# Altium project ezlo-thermostat.PrjPcb (part 2 of 3)

## Sheet Output-Sheet.SchDoc: =Projectname
size A4; SheetNumber: 4; SheetTotal: 9
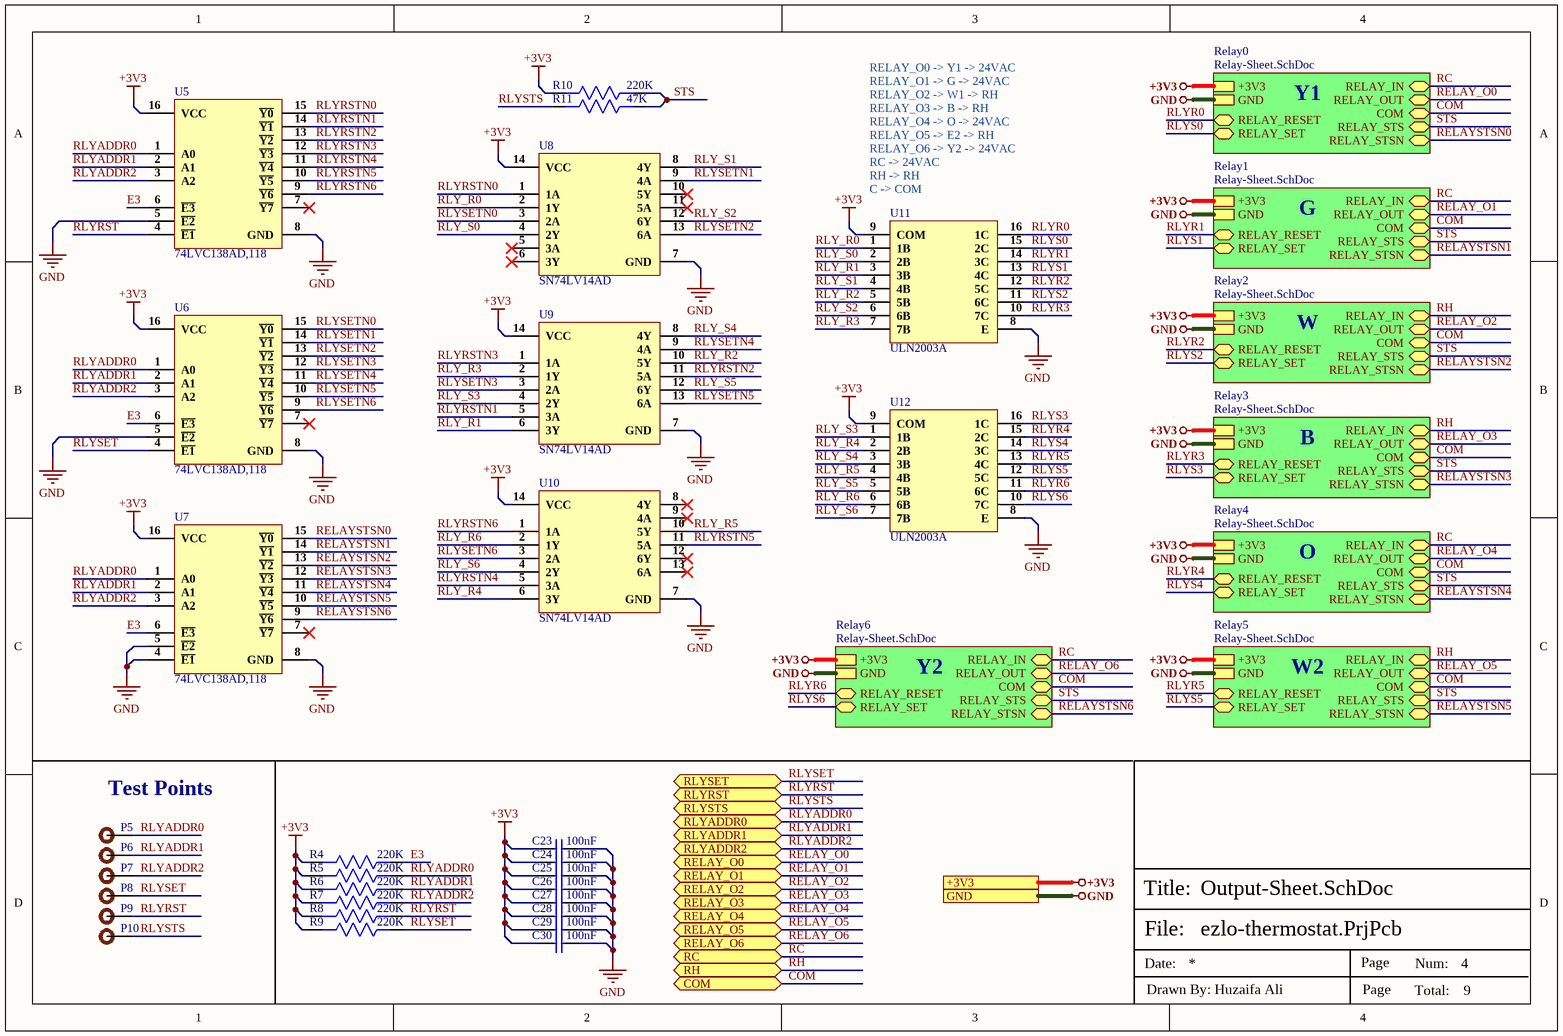
[diagram p3: Output-Sheet.SchDoc]

### Parts
C23  100nF  [Cap-0402]
C24  100nF  [Cap-0402]
C25  100nF  [Cap-0402]
C26  100nF  [Cap-0402]
C27  100nF  [Cap-0402]
C28  100nF  [Cap-0402]
C29  100nF  [Cap-0402]
C30  100nF  [Cap-0402]
P5  TEST POINT  [Test-point]  (value not drawn)
P6  TEST POINT  [Test-point]  (value not drawn)
P7  TEST POINT  [Test-point]  (value not drawn)
P8  TEST POINT  [Test-point]  (value not drawn)
P9  TEST POINT  [Test-point]  (value not drawn)
P10  TEST POINT  [Test-point]  (value not drawn)
R4  220K  [Res-0402]
R5  220K  [Res-0402]
R6  220K  [Res-0402]
R7  220K  [Res-0402]
R8  220K  [Res-0402]
R9  220K  [Res-0402]
R10  220K  [Res-0402]
R11  47K  [Res-0402]
U5  74LVC138AD,118  [16-SOIC]
U6  74LVC138AD,118  [16-SOIC]
U7  74LVC138AD,118  [16-SOIC]
U8  SN74LV14AD  [14-SOIC]
U9  SN74LV14AD  [14-SOIC]
U10  SN74LV14AD  [14-SOIC]
U11  ULN2003A  [SOP-16_150mil]
U12  ULN2003A  [SOP-16_150mil]

### Sub-sheets
Relay0 = Relay-Sheet.SchDoc: +3V3, GND, RELAY_RESET (bidir), RELAY_SET (bidir), RELAY_IN (bidir), RELAY_OUT (bidir), COM (bidir), RELAY_STS (bidir), RELAY_STSN (bidir)
Relay1 = Relay-Sheet.SchDoc: +3V3, GND, RELAY_RESET (bidir), RELAY_SET (bidir), RELAY_IN (bidir), RELAY_OUT (bidir), COM (bidir), RELAY_STS (bidir), RELAY_STSN (bidir)
Relay2 = Relay-Sheet.SchDoc: +3V3, GND, RELAY_RESET (bidir), RELAY_SET (bidir), RELAY_IN (bidir), RELAY_OUT (bidir), COM (bidir), RELAY_STS (bidir), RELAY_STSN (bidir)
Relay3 = Relay-Sheet.SchDoc: +3V3, GND, RELAY_RESET (bidir), RELAY_SET (bidir), RELAY_IN (bidir), RELAY_OUT (bidir), COM (bidir), RELAY_STS (bidir), RELAY_STSN (bidir)
Relay4 = Relay-Sheet.SchDoc: +3V3, GND, RELAY_RESET (bidir), RELAY_SET (bidir), RELAY_IN (bidir), RELAY_OUT (bidir), COM (bidir), RELAY_STS (bidir), RELAY_STSN (bidir)
Relay5 = Relay-Sheet.SchDoc: +3V3, GND, RELAY_RESET (bidir), RELAY_SET (bidir), RELAY_IN (bidir), RELAY_OUT (bidir), COM (bidir), RELAY_STS (bidir), RELAY_STSN (bidir)
Relay6 = Relay-Sheet.SchDoc: +3V3, GND, RELAY_RESET (bidir), RELAY_SET (bidir), RELAY_IN (bidir), RELAY_OUT (bidir), COM (bidir), RELAY_STS (bidir), RELAY_STSN (bidir)

### Ports
+3V3, COM (bidir), GND, RC (bidir), RELAY_O0 (bidir), RELAY_O1 (bidir), RELAY_O2 (bidir), RELAY_O3 (bidir), RELAY_O4 (bidir), RELAY_O5 (bidir), RELAY_O6 (bidir), RH (bidir), RLYADDR0 (bidir), RLYADDR1 (bidir), RLYADDR2 (bidir), RLYRST (bidir), RLYSET (bidir), RLYSTS (bidir)

### Nets
+3V3: C23.1 C24.1 C25.1 C26.1 C27.1 C28.1 C29.1 C30.1 R4.2 R5.2 R6.2 R7.2 R8.2 R9.2 R10.2 U5.16(VCC) U6.16(VCC) U7.16(VCC) U8.14(VCC) U9.14(VCC) U10.14(VCC) U11.9(COM) U12.9(COM) ; port +3V3, sheet Relay0/+3V3, sheet Relay1/+3V3, sheet Relay2/+3V3, sheet Relay3/+3V3, sheet Relay4/+3V3, sheet Relay5/+3V3, sheet Relay6/+3V3
GND: C23.2 C24.2 C25.2 C26.2 C27.2 C28.2 C29.2 C30.2 U5.5(~{E2}) U5.8(GND) U6.5(~{E2}) U6.8(GND) U7.4(~{E1}) U7.5(~{E2}) U7.8(GND) U8.7(GND) U9.7(GND) U10.7(GND) U11.8(E) U12.8(E) ; port GND, sheet Relay0/GND, sheet Relay1/GND, sheet Relay2/GND, sheet Relay3/GND, sheet Relay4/GND, sheet Relay5/GND, sheet Relay6/GND
COM: port COM, sheet Relay0/COM, sheet Relay1/COM, sheet Relay2/COM, sheet Relay3/COM, sheet Relay4/COM, sheet Relay5/COM, sheet Relay6/COM  [project net C]
E3: R4.1 U5.6(~{E3}) U6.6(~{E3}) U7.6(~{E3})
RC: port RC, sheet Relay0/RELAY_IN, sheet Relay1/RELAY_IN, sheet Relay4/RELAY_IN, sheet Relay6/RELAY_IN
RELAY_O0: port RELAY_O0, sheet Relay0/RELAY_OUT
RELAY_O1: port RELAY_O1, sheet Relay1/RELAY_OUT  [project net G]
RELAY_O2: port RELAY_O2, sheet Relay2/RELAY_OUT
RELAY_O3: port RELAY_O3, sheet Relay3/RELAY_OUT  [project net B]
RELAY_O4: port RELAY_O4, sheet Relay4/RELAY_OUT  [project net O]
RELAY_O5: port RELAY_O5, sheet Relay5/RELAY_OUT
RELAY_O6: port RELAY_O6, sheet Relay6/RELAY_OUT
RELAYSTSN0: U7.15(~{Y0}) ; sheet Relay0/RELAY_STSN  [project net RELAY_STSN]
RELAYSTSN1: U7.14(~{Y1}) ; sheet Relay1/RELAY_STSN  [project net RELAY_STSN]
RELAYSTSN2: U7.13(~{Y2}) ; sheet Relay2/RELAY_STSN  [project net RELAY_STSN]
RELAYSTSN3: U7.12(~{Y3}) ; sheet Relay3/RELAY_STSN  [project net RELAY_STSN]
RELAYSTSN4: U7.11(~{Y4}) ; sheet Relay4/RELAY_STSN  [project net RELAY_STSN]
RELAYSTSN5: U7.10(~{Y5}) ; sheet Relay5/RELAY_STSN  [project net RELAY_STSN]
RELAYSTSN6: U7.9(~{Y6}) ; sheet Relay6/RELAY_STSN  [project net RELAY_STSN]
RH: port RH, sheet Relay2/RELAY_IN, sheet Relay3/RELAY_IN, sheet Relay5/RELAY_IN  [project net RELAY_IN]
RLY_R0: U8.2(1Y) U11.1(1B)
RLY_R1: U9.6(3Y) U11.3(3B)
RLY_R2: U9.10(5Y) U11.5(5B)
RLY_R3: U9.2(1Y) U11.7(7B)
RLY_R4: U10.6(3Y) U12.2(2B)
RLY_R5: U10.10(5Y) U12.4(4B)
RLY_R6: U10.2(1Y) U12.6(6B)
RLY_S0: U8.4(2Y) U11.2(2B)
RLY_S1: U8.8(4Y) U11.4(4B)
RLY_S2: U8.12(6Y) U11.6(6B)
RLY_S3: U9.4(2Y) U12.1(1B)
RLY_S4: U9.8(4Y) U12.3(3B)
RLY_S5: U9.12(6Y) U12.5(5B)
RLY_S6: U10.4(2Y) U12.7(7B)
RLYADDR0: P5.1 R5.1 U5.1(A0) U6.1(A0) U7.1(A0) ; port RLYADDR0  [project net GPIO7]
RLYADDR1: P6.1 R6.1 U5.2(A1) U6.2(A1) U7.2(A1) ; port RLYADDR1  [project net GPIO8]
RLYADDR2: P7.1 R7.1 U5.3(A2) U6.3(A2) U7.3(A2) ; port RLYADDR2  [project net GPIO9]
RLYR0: U11.16(1C) ; sheet Relay0/RELAY_RESET  [project net RELAY_RESET]
RLYR1: U11.14(3C) ; sheet Relay1/RELAY_RESET  [project net RELAY_RESET]
RLYR2: U11.12(5C) ; sheet Relay2/RELAY_RESET  [project net RELAY_RESET]
RLYR3: U11.10(7C) ; sheet Relay3/RELAY_RESET  [project net RELAY_RESET]
RLYR4: U12.15(2C) ; sheet Relay4/RELAY_RESET  [project net RELAY_RESET]
RLYR5: U12.13(4C) ; sheet Relay5/RELAY_RESET  [project net RELAY_RESET]
RLYR6: U12.11(6C) ; sheet Relay6/RELAY_RESET  [project net RELAY_RESET]
RLYRST: P9.1 R8.1 U5.4(~{E1}) ; port RLYRST  [project net GPIO5]
RLYRSTN0: U5.15(~{Y0}) U8.1(1A)
RLYRSTN1: U5.14(~{Y1}) U9.5(3A)
RLYRSTN2: U5.13(~{Y2}) U9.11(5A)
RLYRSTN3: U5.12(~{Y3}) U9.1(1A)
RLYRSTN4: U5.11(~{Y4}) U10.5(3A)
RLYRSTN5: U5.10(~{Y5}) U10.11(5A)
RLYRSTN6: U5.9(~{Y6}) U10.1(1A)
RLYS0: U11.15(2C) ; sheet Relay0/RELAY_SET  [project net RELAY_SET]
RLYS1: U11.13(4C) ; sheet Relay1/RELAY_SET  [project net RELAY_SET]
RLYS2: U11.11(6C) ; sheet Relay2/RELAY_SET  [project net RELAY_SET]
RLYS3: U12.16(1C) ; sheet Relay3/RELAY_SET  [project net RELAY_SET]
RLYS4: U12.14(3C) ; sheet Relay4/RELAY_SET  [project net RELAY_SET]
RLYS5: U12.12(5C) ; sheet Relay5/RELAY_SET  [project net RELAY_SET]
RLYS6: U12.10(7C) ; sheet Relay6/RELAY_SET  [project net RELAY_SET]
RLYSET: P8.1 R9.1 U6.4(~{E1}) ; port RLYSET  [project net GPIO4]
RLYSETN0: U6.15(~{Y0}) U8.3(2A)
RLYSETN1: U6.14(~{Y1}) U8.9(4A)
RLYSETN2: U6.13(~{Y2}) U8.13(6A)
RLYSETN3: U6.12(~{Y3}) U9.3(2A)
RLYSETN4: U6.11(~{Y4}) U9.9(4A)
RLYSETN5: U6.10(~{Y5}) U9.13(6A)
RLYSETN6: U6.9(~{Y6}) U10.3(2A)
RLYSTS: P10.1 R11.2 ; port RLYSTS  [project net GPIO6]
STS: R10.1 R11.1 ; sheet Relay0/RELAY_STS, sheet Relay1/RELAY_STS, sheet Relay2/RELAY_STS, sheet Relay3/RELAY_STS, sheet Relay4/RELAY_STS, sheet Relay5/RELAY_STS, sheet Relay6/RELAY_STS  [project net RELAY_STS]

Not connected (* = marked no-connect by the designer): U5 7(~{Y7})*; U6 7(~{Y7})*; U7 7(~{Y7})*; U8 5(3A)* 6(3Y)* 10(5Y)* 11(5A)*; U10 8(4Y)* 9(4A)* 12(6Y)* 13(6A)*

### Notes on the sheet
- Y1
- (near U11) RELAY_O0 -> Y1 -> 24VAC
  RELAY_O1 -> G -> 24VAC
  RELAY_O2 -> W1 -> RH
  RELAY_O3 -> B -> RH
  RELAY_O4 -> O -> 24VAC
  RELAY_O5 -> E2 -> RH
  RELAY_O6 -> Y2 -> 24VAC
  RC -> 24VAC
  RH -> RH
  C -> COM
- G
- W
- B
- O
- Y2
- W2
- Test Points
- File:
- Title:
- Date:
- Page
- Num:
- Total:
- Drawn By: Huzaifa Ali

### Library data of the parts
C23-C30 = CC0402KRX5R8BB104: CAP CER 0.1UF 25V X5R 0402; Manufacturer: Yageo; Tolerance: 10%; Item Type: Capacitor; Supplier 1: Digi-Key; Manufacturer Part Number: CC0402KRX5R8BB104; RoHS: Yes; Category: Ceramic Capacitors; Stock 1: 4598218; Pricing 1: 1=0.10000, 10=0.03800, 50=0.02100, 100=0.01710, 500=0.01224, 1000=0.00961, 2500=0.00874, 5000=0.00804 (USD); Mount: Surface Mount; Case/Package: 0402; Case Code (Metric): 1005; Case Code (Imperial): 0402; Min Operating Temperature: -55°C; Max Operating Temperature: 85°C; Voltage Rating: 25V; Packaging: Tape and Reel; Capacitance: 100nF; Voltage Rating (DC): 25V; Dielectric: X5R; Resistor Type: Ceramic; Series: CC; Length: 0.039inch; Width: 0.02inch; Thickness: 0.022inch; Depth: 0.5mm; Lead Free: Lead Free; Halogen Free: Halogen Free; RoHS Compliant: Yes; ComponentLink1URL: http://www.mouser.com/ds/2/447/UPY-GPHC_X5R_4V-to-50V_25-1131599.pdf?src-supplier=Mouser; ComponentLink1Description: http://www.mouser.com/ds/2/447/UPY-GPHC_X5R_4V-to-50V_25-1131599.pdf?src-supplier=Mouser; ComponentLink2URL: http://www.yageo.com/documents/recent/UPY-GPHC_X5R_4V-to-50V-16.pdf?src-supplier=Future+Electronics; ComponentLink2Description: http://www.yageo.com/documents/recent/UPY-GPHC_X5R_4V-to-50V-16.pdf?src-supplier=Future+Electronics; ComponentLink3URL: http://www.yageo.com/documents/recent/UPY-GPHC_X5R_4V-to-50V_25.pdf?src-supplier=Digi-Key; ComponentLink3Description: http://www.yageo.com/documents/recent/UPY-GPHC_X5R_4V-to-50V_25.pdf?src-supplier=Digi-Key; Supplier Part Number 1: 311-1697-1-ND; LCSC Part Number: C106256
P5-P10 = TEST POINT: Test Point ON
R4-R10 = RC0402FR-07220KL: RES 220K OHM 1% 1/16W 0402; Manufacturer: Yageo; Resistance: 220kR; Power Rating: 62.5mW; Voltage Rating: 50V; Temperature Coefficient: 100ppm/°C; Max Power Dissipation: 63mW; Supplier 1: Digi-Key; Manufacturer Part Number: RC0402FR-07220KL; RoHS: Yes; Category: Chip SMD Resistors; Stock 1: 1192792; Pricing 1: 1=0.10000, 10=0.01400, 100=0.00580, 1000=0.00262, 2500=0.00228, 5000=0.00188 (USD); Case/Package: 0402; Case Code (Imperial): 0402; Case Code (Metric): 1005; Weight: 2.3E-05oz; Size Code: 0402; Min Operating Temperature: -55°C; Max Operating Temperature: 155°C; Tolerance: 1%; Package Quantity: 1; Packaging: Tape and Reel; Termination: SMD/SMT; Resistor Type: Thick Film; Number of Terminations: 2; Features: Moisture Resistant; Series: RC; Resistance Tolerance: 1%; Technology: THICK FILM; Construction: Rectangular; Length: 1mm; Width: 0.02inch; Height: 0.016inch; Depth: 0.5mm; RoHS Compliant: Yes; Reach SVHC Compliant: Yes; Military Standard: Not; Lead Free: Lead Free; ComponentLink1URL: https://datasheet.ciiva.com/11808/0900766b80c66297-11808792.pdf?src-supplier=RSComponents; ComponentLink1Description: https://datasheet.ciiva.com/11808/0900766b80c66297-11808792.pdf?src-supplier=RSComponents; ComponentLink2URL: https://datasheet.ciiva.com/5924/1018594-5924944.pdf?src-supplier=Farnell; ComponentLink2Description: https://datasheet.ciiva.com/5924/1018594-5924944.pdf?src-supplier=Farnell; ComponentLink3URL: https://datasheet.ciiva.com/2453/pyu-r-int-thick-7-2453533.pdf?src-supplier=Digi-Key; ComponentLink3Description: https://datasheet.ciiva.com/2453/pyu-r-int-thick-7-2453533.pdf?src-supplier=Digi-Key; ComponentLink4URL: https://datasheet.ciiva.com/2453/pyu-r-int-thick-7-2453534.pdf?src-supplier=Digi-Key; ComponentLink4Description: https://datasheet.ciiva.com/2453/pyu-r-int-thick-7-2453534.pdf?src-supplier=Digi-Key; ComponentLink5URL: https://datasheet.ciiva.com/2453/pyu-r-int-thick-7-2453532.pdf?src-supplier=Digi-Key; ComponentLink5Description: https://datasheet.ciiva.com/2453/pyu-r-int-thick-7-2453532.pdf?src-supplier=Digi-Key; ComponentLink6URL: https://datasheet.ciiva.com/12577/pyu-rc0402-51-rohs-l-6-r-12577270.pdf?src-supplier=Mouser; ComponentLink6Description: https://datasheet.ciiva.com/12577/pyu-rc0402-51-rohs-l-6-r-12577270.pdf?src-supplier=Mouser; Supplier Part Number 1: 311-220KLRCT-ND
R11 = RC0402FR-0747KL: RES 47K OHM 1% 1/16W 0402; Manufacturer: Yageo; Power Rating: 62.5mW; Temperature Coefficient: 100ppm/°C; Voltage Rating: 50V; Resistance: 47kR; Max Power Dissipation: 63mW; Item Type: Resistor; Supplier 1: Avnet; Manufacturer Part Number: RC0402FR-0747KL; RoHS: Yes; Category: Chip SMD Resistors; Stock 1: 680000; Pricing 1: 10000=0.00085, 20000=0.00087, 40000=0.00084, 60000=0.00083, 80000=0.00079, 100000=0.00078, 1000000=0.00076 (USD); Case/Package: 0402; Case Code (Imperial): 0402; Case Code (Metric): 1005; Size Code: 0402; Min Operating Temperature: -55°C; Max Operating Temperature: 155°C; Tolerance: 1%; Series: RC; Packaging: Tape and Reel; Package Quantity: 1; Termination: SMD/SMT; Resistor Type: Thick Film; Number of Terminations: 2; Features: Moisture Resistant; Resistance Tolerance: 1%; Construction: Rectangular; Length: 1mm; Width: 0.02inch; Height: 0.016inch; Depth: 0.5mm; RoHS Compliant: Yes; Military Standard: Not; Lead Free: Lead Free; ComponentLink1URL: https://datasheet.ciiva.com/46412/1018594-46412839.pdf?src-supplier=Element14; ComponentLink1Description: https://datasheet.ciiva.com/46412/1018594-46412839.pdf?src-supplier=Element14; ComponentLink2URL: https://datasheet.ciiva.com/2453/pyu-r-int-thick-7-2453389.pdf?src-supplier=Digi-Key; ComponentLink2Description: https://datasheet.ciiva.com/2453/pyu-r-int-thick-7-2453389.pdf?src-supplier=Digi-Key; ComponentLink3URL: https://datasheet.ciiva.com/2453/pyu-r-int-thick-7-2453390.pdf?src-supplier=Digi-Key; ComponentLink3Description: https://datasheet.ciiva.com/2453/pyu-r-int-thick-7-2453390.pdf?src-supplier=Digi-Key; ComponentLink4URL: https://datasheet.ciiva.com/2453/pyu-r-int-thick-7-2453388.pdf?src-supplier=Digi-Key; ComponentLink4Description: https://datasheet.ciiva.com/2453/pyu-r-int-thick-7-2453388.pdf?src-supplier=Digi-Key; ComponentLink5URL: https://datasheet.ciiva.com/15189/getdatasheetpartid-323748-15189466.pdf?src-supplier=Verical; ComponentLink5Description: https://datasheet.ciiva.com/15189/getdatasheetpartid-323748-15189466.pdf?src-supplier=Verical; ComponentLink6URL: https://datasheet.ciiva.com/16793/pyu-rc0402-51-rohs-l-6-r-16793430.pdf?src-supplier=Future+Electronics; ComponentLink6Description: https://datasheet.ciiva.com/16793/pyu-rc0402-51-rohs-l-6-r-16793430.pdf?src-supplier=Future+Electronics; Supplier Part Number 1: RC0402FR-0747KL; LCSC Part Number: C93943
U5-U7 = 74LVC138AD,118: IC DECODER/DEMUX 3-8 INV 16SOIC; Manufacturer: Nexperia; Supplier 1: Avnet; Manufacturer Part Number: 74LVC138AD,118; RoHS: Yes; Category: Decoders and Multiplexers; Stock 1: 17684; Pricing 1: 2995=0.11690, 3000=0.11440, 6000=0.11189, 15000=0.10939, 30000=0.10688, 150000=0.10438, 300000=0.10187 (USD); RoHS Compliant: Yes; Supplier Part Number 1: 74LVC138AD,118; LCSC Part Number: C6061; Item Type: IC; ComponentLink1Description: LCSC; ComponentLink1URL: https://www.lcsc.com/product-detail/Signal-Switches-Encoders-Decoders-Multiplexers_Nexperia-74LVC138AD-118_C6061.html
U8-U10 = SN74LV14AD: SOIC-14 Inverters ROHS; Manufacturer: Texas Instruments; Logic Function: Buffer,Inverter,Schmitt Trigger; Number of Elements: 6; Output Current: 12mA; Number of Inputs: 1; Min Supply Voltage: 2V; Max Supply Voltage: 5.5V; Propagation Delay: 27ns; Quiescent Current: 20uA; High Level Output Current: -12mA; Turn-On Delay Time: 12ns; Input Type: SCHMITT TRIGGER; Schmitt Trigger Input: Yes; Item Type: IC; Supplier 1: Digi-Key; Manufacturer Part Number: SN74LV14AD; RoHS: Yes; Category: Logic Gates; Stock 1: 2467; Pricing 1: 1=1.16000, 10=1.04100, 25=0.98840, 100=0.81190, 250=0.75892, 500=0.67066, 1000=0.52947, 2500=0.49950 (USD); Mount: Surface Mount; Case/Package: SOIC; Number of Pins: 14; Weight: 0.004318oz; Min Operating Temperature: -40°C; Max Operating Temperature: 125°C; Package Quantity: 50; Packaging: Rail/Tube; Number of Circuits: 6; Low Level Output Current: 12mA; Series: 74LV; Technology: CMOS; Number of Bits: 6; Number of Gates: 6; Length: 8.65mm; Width: 3.91mm; Height: 1.58mm; Radiation Hardening: No; Lead Free: Lead Free; RoHS Compliant: Yes; Reach SVHC Compliant: Yes; ComponentLink1URL: https://datasheet.ciiva.com/27050/917231-27050962.pdf?src-supplier=Jameco; ComponentLink1Description: https://datasheet.ciiva.com/27050/917231-27050962.pdf?src-supplier=Jameco; ComponentLink2URL: https://datasheet.ciiva.com/7948/1633820-7948979.pdf?src-supplier=Element14; ComponentLink2Description: https://datasheet.ciiva.com/7948/1633820-7948979.pdf?src-supplier=Element14; ComponentLink3URL: https://datasheet.ciiva.com/15089/getdatasheetpartid-253475-15089486.pdf?src-supplier=Verical; ComponentLink3Description: https://datasheet.ciiva.com/15089/getdatasheetpartid-253475-15089486.pdf?src-supplier=Verical; ComponentLink4URL: https://datasheet.ciiva.com/1866/sn74lv14a-1866324.pdf?src-supplier=Digi-Key; ComponentLink4Description: https://datasheet.ciiva.com/1866/sn74lv14a-1866324.pdf?src-supplier=Digi-Key; ComponentLink5URL: https://datasheet.ciiva.com/14290/sn74lv14a-14290269.pdf?src-supplier=Avnet; ComponentLink5Description: https://datasheet.ciiva.com/14290/sn74lv14a-14290269.pdf?src-supplier=Avnet; Supplier Part Number 1: 296-1678-5-ND; LCSC Part Number: C2860778
U11 U12 = ULN2003A: 100uA@50V 3V@2V,300mA 1.6V@350mA 4mA@12V 100uA@50V 1.25V@350mA 500mA 25pF SOP-16_150mil Darlington Transistor Arrays ROHS; Manufacturer: Mixic; Item Type: IC; Manufacturer Part Number: ULN2003A; Package: SOP-16_150mil; LCSC Part Number: C181730; ComponentLink1Description: LCSC; ComponentLink1URL: https://www.lcsc.com/product-detail/Darlington-Transistor-Arrays_Mixic-ULN2003A_C181730.html

## Sheet Relay-Sheet.SchDoc: =Projectname
size A4; SheetNumber: 6; SheetTotal: 9
Used 7 times, as channels U_Output-Sheet/Relay0, U_Output-Sheet/Relay1, U_Output-Sheet/Relay2, U_Output-Sheet/Relay3, U_Output-Sheet/Relay4, U_Output-Sheet/Relay5, U_Output-Sheet/Relay6. Parts and nets are listed once, with the designators drawn on the sheet.
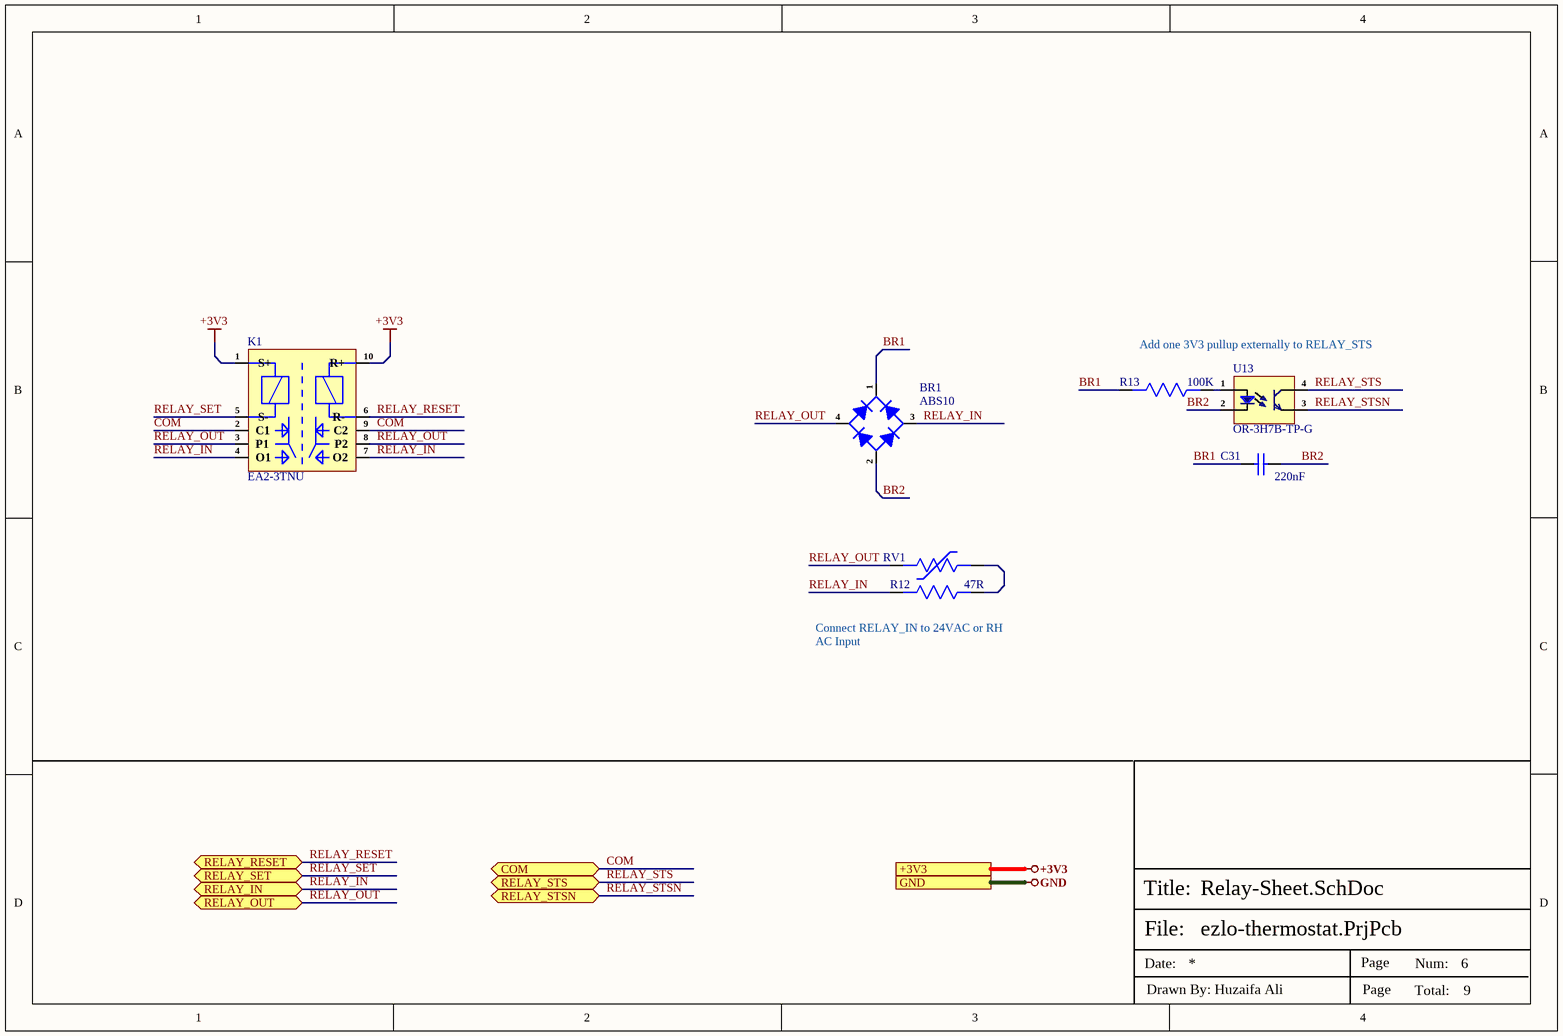
[diagram p4: Relay-Sheet.SchDoc]

### Parts
BR1  ABS10  [ABS]
C31  220nF  [Cap-1206]
K1  EA2-3TNU  [EA2-3TNU]
R12  47R  [Res-0402]
R13  100K  [Res-0402]
RV1  ERZ-V07D680  [ERZ-V07D680]  (value not drawn)
U13  OR-3H7B-TP-G  [SOP-4-1.27mm pitch Body 2.6mm]

### Ports
+3V3, COM (bidir), GND, RELAY_IN (bidir), RELAY_OUT (bidir), RELAY_RESET (bidir), RELAY_SET (bidir), RELAY_STS (bidir), RELAY_STSN (bidir)

### Nets
+3V3: K1.1(S+) K1.10(R+) ; port +3V3
BR1: BR1.1 C31.2 R13.2
BR2: BR1.2 C31.1 U13.2(Ca)
COM: K1.2(C1) K1.9(C2) ; port COM
RELAY_IN: BR1.3 K1.4(O1) K1.7(O2) R12.2 ; port RELAY_IN
RELAY_OUT: BR1.4 K1.3(P1) K1.8(P2) RV1.2 ; port RELAY_OUT
RELAY_RESET: K1.6(R-) ; port RELAY_RESET
RELAY_SET: K1.5(S-) ; port RELAY_SET
RELAY_STS: U13.4(C) ; port RELAY_STS
RELAY_STSN: U13.3(E) ; port RELAY_STSN
NetR12_1: R12.1 RV1.1
NetR13_1: R13.1 U13.1(An)

### Channels
U_Output-Sheet/Relay0: designators end in _Relay0; ports +3V3=+3V3 COM=C GND=GND RELAY_IN=RC RELAY_OUT=RELAY_O0 RELAY_RESET=RELAY_RESET RELAY_SET=RELAY_SET RELAY_STS=RELAY_STS RELAY_STSN=RELAY_STSN
U_Output-Sheet/Relay1: designators end in _Relay1; ports +3V3=+3V3 COM=C GND=GND RELAY_IN=RC RELAY_OUT=G RELAY_RESET=RELAY_RESET RELAY_SET=RELAY_SET RELAY_STS=RELAY_STS RELAY_STSN=RELAY_STSN
U_Output-Sheet/Relay2: designators end in _Relay2; ports +3V3=+3V3 COM=C GND=GND RELAY_IN=RELAY_IN RELAY_OUT=RELAY_O2 RELAY_RESET=RELAY_RESET RELAY_SET=RELAY_SET RELAY_STS=RELAY_STS RELAY_STSN=RELAY_STSN
U_Output-Sheet/Relay3: designators end in _Relay3; ports +3V3=+3V3 COM=C GND=GND RELAY_IN=RELAY_IN RELAY_OUT=B RELAY_RESET=RELAY_RESET RELAY_SET=RELAY_SET RELAY_STS=RELAY_STS RELAY_STSN=RELAY_STSN
U_Output-Sheet/Relay4: designators end in _Relay4; ports +3V3=+3V3 COM=C GND=GND RELAY_IN=RC RELAY_OUT=O RELAY_RESET=RELAY_RESET RELAY_SET=RELAY_SET RELAY_STS=RELAY_STS RELAY_STSN=RELAY_STSN
U_Output-Sheet/Relay5: designators end in _Relay5; ports +3V3=+3V3 COM=C GND=GND RELAY_IN=RELAY_IN RELAY_OUT=RELAY_O5 RELAY_RESET=RELAY_RESET RELAY_SET=RELAY_SET RELAY_STS=RELAY_STS RELAY_STSN=RELAY_STSN
U_Output-Sheet/Relay6: designators end in _Relay6; ports +3V3=+3V3 COM=C GND=GND RELAY_IN=RC RELAY_OUT=RELAY_O6 RELAY_RESET=RELAY_RESET RELAY_SET=RELAY_SET RELAY_STS=RELAY_STS RELAY_STSN=RELAY_STSN

### Notes on the sheet
- Add one 3V3 pullup externally to RELAY_STS
- (near R12) Connect RELAY_IN to 24VAC or RH
  AC Input
- File:
- Title:
- Date:
- Page
- Num:
- Total:
- Drawn By: Huzaifa Ali

### Library data of the parts
BR1 = ABS10: 5uA@1kV 1V@0.4A 1A 1kV -55℃~+150℃@(Tj) ABS Bridge Rectifiers ROHS; Manufacturer: FOSAN; Package: ABS; Manufacturer Part Number: ABS10; Item Type: Bridge Rectifier; LCSC Part Number: C3014049; ComponentLink1Description: LCSC; ComponentLink1URL: https://www.lcsc.com/product-detail/Bridge-Rectifiers_FOSAN-ABS10_C3014049.html
C31 = 1206B224K500NT: 50V 220nF X7R ±10% 1206 Multilayer Ceramic Capacitors MLCC - SMD/SMT ROHS; Manufacturer: FH; Manufacturer Part Number: 1206B224K500NT; Package: 1206; LCSC Part Number: C1857; Item Type: Capacitor; ComponentLink1Description: LCSC; ComponentLink1URL: https://www.lcsc.com/product-detail/Multilayer-Ceramic-Capacitors-MLCC-SMD-SMT_FH-Guangdong-Fenghua-Advanced-Tech-1206B224K500NT_C1857.html
K1 = EA2-3TNU: Relay Gen Purpose DPDT 1A 3VDC; Manufacturer: KEMET; Coil Current: 46.7mA; Coil Type: Latching, Dual Coil; Coil Voltage (DC): 3V; Coil Resistance: 64.3R; Relay Type: General Purpose; Operate Time: 2ms; Release Time: 1ms; Coil Power: 140mW; Supplier 1: Mouser; Manufacturer Part Number: EA2-3TNU; RoHS: No; Category: Uncategorized; Stock 1: 873; Pricing 1: 1=3.85000, 10=3.11000, 50=3.11000, 100=2.42000, 250=2.00000, 500=1.85000, 1000=1.85000, 3600=1.58000, 10000=1.58000 (USD); Mount: Through Hole; Contact Material: Gold,Silver; Min Operating Temperature: -40°C; Max Operating Temperature: 85°C; Throw Configuration: DPDT; Package Quantity: 3600; Termination: PC Pin; Packaging: Rail/Tube; Contact Current Rating: 1A; RoHS Compliant: No; ComponentLink1URL: https://api.kemet.com/component-edge/download/datasheet/EA2-3TNU.pdf?src-supplier=Digi-Key; ComponentLink1Description: https://api.kemet.com/component-edge/download/datasheet/EA2-3TNU.pdf?src-supplier=Digi-Key; Supplier Part Number 1: 80-EA2-3TNU; LCSC Part Number: C1560650; Item Type: Relay
R12 = RC0402FR-0747RL: RES 47 OHM 1% 1/16W 0402; Manufacturer: Yageo; Temperature Coefficient: 100ppm/°C; Power Rating: 63mW; Voltage Rating: 50V; Supplier 1: Digi-Key; Manufacturer Part Number: RC0402FR-0747RL; RoHS: Yes; Category: Chip SMD Resistors; Stock 1: 913647; Pricing 1: 1=0.10000, 10=0.01400, 100=0.00580, 1000=0.00262, 2500=0.00228, 5000=0.00188 (USD); Case/Package: 0402; Case Code (Metric): 1005; Case Code (Imperial): 0402; Weight: 2.3E-05oz; Size Code: 0402; Min Operating Temperature: -55°C; Max Operating Temperature: 155°C; Resistance: 47R; Tolerance: 1%; Packaging: Tape and Reel; Resistor Type: Thick Film; Package Quantity: 1; Number of Terminations: 2; Termination: SMD/SMT; Max Power Dissipation: 63mW; Features: Moisture Resistant; Series: RC; Construction: Rectangular; Technology: THICK FILM; Resistance Tolerance: 1%; Length: 1mm; Width: 0.02inch; Height: 0.016inch; Depth: 0.5mm; Lead Free: Lead Free; Military Standard: Not; RoHS Compliant: Yes; Supplier Part Number 1: 311-47.0LRCT-ND
R13 = RC0402FR-07100KL: RES 100K OHM 1% 1/16W 0402; Manufacturer: Yageo; Resistance: 100kR; Temperature Coefficient: 100ppm/°C; Power Rating: 63mW; Voltage Rating: 50V; Supplier 1: Mouser; Manufacturer Part Number: RC0402FR-07100KL; RoHS: Yes; Category: Chip SMD Resistors; Stock 1: 7759549; Pricing 1: 1=0.10000, 10=0.01200, 50=0.01200, 100=0.00500, 1000=0.00300, 2500=0.00200, 10000=0.00100 (USD); Case/Package: 0402; Case Code (Metric): 1005; Case Code (Imperial): 0402; Min Operating Temperature: -55°C; Max Operating Temperature: 155°C; Resistor Type: Thick Film; Tolerance: 1%; Packaging: Tape and Reel; Package Quantity: 1; Number of Terminations: 2; Termination: SMD/SMT; Max Power Dissipation: 63mW; Working Voltage: 50V; Features: Moisture Resistant; Series: RC; Resistance Tolerance: 1%; Construction: Rectangular; Technology: THICK FILM; Length: 0.039inch; Width: 0.02inch; Height: 0.016inch; Depth: 0.5mm; REACH SVHC: No SVHC; Lead Free: Lead Free; RoHS Compliant: Yes; Military Standard: Not; ComponentLink1URL: https://datasheet.ciiva.com/11819/0900766b80c66297-11819452.pdf?src-supplier=RSComponents; ComponentLink1Description: https://datasheet.ciiva.com/11819/0900766b80c66297-11819452.pdf?src-supplier=RSComponents; ComponentLink2URL: https://datasheet.ciiva.com/22747/1018594-22747509.pdf?src-supplier=Element14; ComponentLink2Description: https://datasheet.ciiva.com/22747/1018594-22747509.pdf?src-supplier=Element14; ComponentLink3URL: https://datasheet.ciiva.com/2453/pyu-r-int-thick-7-2453362.pdf?src-supplier=Digi-Key; ComponentLink3Description: https://datasheet.ciiva.com/2453/pyu-r-int-thick-7-2453362.pdf?src-supplier=Digi-Key; ComponentLink4URL: https://datasheet.ciiva.com/2453/pyu-r-int-thick-7-2453363.pdf?src-supplier=Digi-Key; ComponentLink4Description: https://datasheet.ciiva.com/2453/pyu-r-int-thick-7-2453363.pdf?src-supplier=Digi-Key; ComponentLink5URL: https://datasheet.ciiva.com/2453/pyu-r-int-thick-7-2453361.pdf?src-supplier=Digi-Key; ComponentLink5Description: https://datasheet.ciiva.com/2453/pyu-r-int-thick-7-2453361.pdf?src-supplier=Digi-Key; ComponentLink6URL: https://datasheet.ciiva.com/12667/pyu-rc0402-51-rohs-l-6-r-12667930.pdf?src-supplier=Mouser; ComponentLink6Description: https://datasheet.ciiva.com/12667/pyu-rc0402-51-rohs-l-6-r-12667930.pdf?src-supplier=Mouser; ComponentLink7URL: https://datasheet.ciiva.com/15189/getdatasheetpartid-323696-15189334.pdf?src-supplier=Verical; ComponentLink7Description: https://datasheet.ciiva.com/15189/getdatasheetpartid-323696-15189334.pdf?src-supplier=Verical; Supplier Part Number 1: 603-RC0402FR-07100KL
RV1 = ERZ-V07D680: VARISTOR 68V 500A DISC 7MM; Manufacturer: Panasonic; Max Voltage Rating (AC): 40V; Max Voltage Rating (DC): 56V; Capacitance: 1.2nF; Lead/Base Style: Radial; Clamping Voltage: 135V; Clamping Current: 2.5A; Voltage Rating: 75V; Min Varistor Voltage: 61V; Number of Circuits: 1; Energy: 4.1J; Power Rating: 20mW; Supplier 1: Avnet; Manufacturer Part Number: ERZ-V07D680; RoHS: Yes; Category: Varistors; Stock 1: 397; Pricing 1: 1000=0.07517, 1100=0.07421, 2100=0.07294, 5000=0.07103, 10000=0.07039 (USD); Mount: Through Hole,Radial; Case/Package: Radial; Contact Plating: Tin,Matte; Material: Zinc; Min Operating Temperature: -40°C; Max Operating Temperature: 85°C; Max Surge Current: 500A; Voltage Rating (DC): 56V; Voltage Rating (AC): 40V; Packaging: Bulk; Varistor Voltage: 68V; Termination: Radial; Package Quantity: 1000; Max Varistor Voltage: 75V; Max Output Current: 2.5A; Diameter: 7mm; Lead Pitch: 5mm; Depth: 5.2mm; Thickness: 5.2mm; Radiation Hardening: No; Lead Free: Lead Free; ComponentLink1URL: https://datasheet.ciiva.com/11834/0900766b80eefb4d-11834669.pdf?src-supplier=RSComponents; ComponentLink1Description: https://datasheet.ciiva.com/11834/0900766b80eefb4d-11834669.pdf?src-supplier=RSComponents; ComponentLink2URL: https://datasheet.ciiva.com/1278/652464-1278833.pdf?src-supplier=Element14; ComponentLink2Description: https://datasheet.ciiva.com/1278/652464-1278833.pdf?src-supplier=Element14; ComponentLink3URL: https://datasheet.ciiva.com/1283/652464-1283255.pdf?src-supplier=Farnell; ComponentLink3Description: https://datasheet.ciiva.com/1283/652464-1283255.pdf?src-supplier=Farnell; ComponentLink4URL: https://datasheet.ciiva.com/3023/awa0000ce2-3023960.pdf?src-supplier=Avnet; ComponentLink4Description: https://datasheet.ciiva.com/3023/awa0000ce2-3023960.pdf?src-supplier=Avnet; ComponentLink5URL: https://datasheet.ciiva.com/30133/2awa0000ce2-30133483.pdf?src-supplier=Onlinecomponents.com; ComponentLink5Description: https://datasheet.ciiva.com/30133/2awa0000ce2-30133483.pdf?src-supplier=Onlinecomponents.com; ComponentLink6URL: https://datasheet.ciiva.com/16440/awa0000ce2-16440124.pdf?src-supplier=Future+Electronics; ComponentLink6Description: https://datasheet.ciiva.com/16440/awa0000ce2-16440124.pdf?src-supplier=Future+Electronics; ComponentLink7URL: https://datasheet.ciiva.com/24028/awa0000ce2-33884-24028073.pdf?src-supplier=Mouser; ComponentLink7Description: https://datasheet.ciiva.com/24028/awa0000ce2-33884-24028073.pdf?src-supplier=Mouser; ComponentLink8URL: https://datasheet.ciiva.com/1231/652464-1231981.pdf?src-supplier=Newark; ComponentLink8Description: https://datasheet.ciiva.com/1231/652464-1231981.pdf?src-supplier=Newark; Supplier Part Number 1: ERZ-V07D680; LCSC Part Number: C1527506; Item Type: Varistor
U13 = OR-3H7B-TP-G: 80V 3750V 2us@2mA,100Ω -55℃~+125℃ 50mA 3us@2mA,100Ω 0.4V@2.4mA,8mA 1 6V 1.2V Phototransistor DC SOP-4-2.6mm Optocouplers - Phototransistor Output ROHS; Manufacturer: Orient; Manufacturer Part Number: OR-3H7B-TP-G; Package: SOP-4-2.6mm; LCSC Part Number: C282477; Item Type: Optocoupler; ComponentLink1Description: LCSC; ComponentLink1URL: https://www.lcsc.com/product-detail/Optocouplers-Phototransistor-Output_Orient-OR-3H7B-TP-G_C282477.html

## Sheet Output-Connection-Sheet.SchDoc
size A4; SheetNumber: 5; SheetTotal: 9
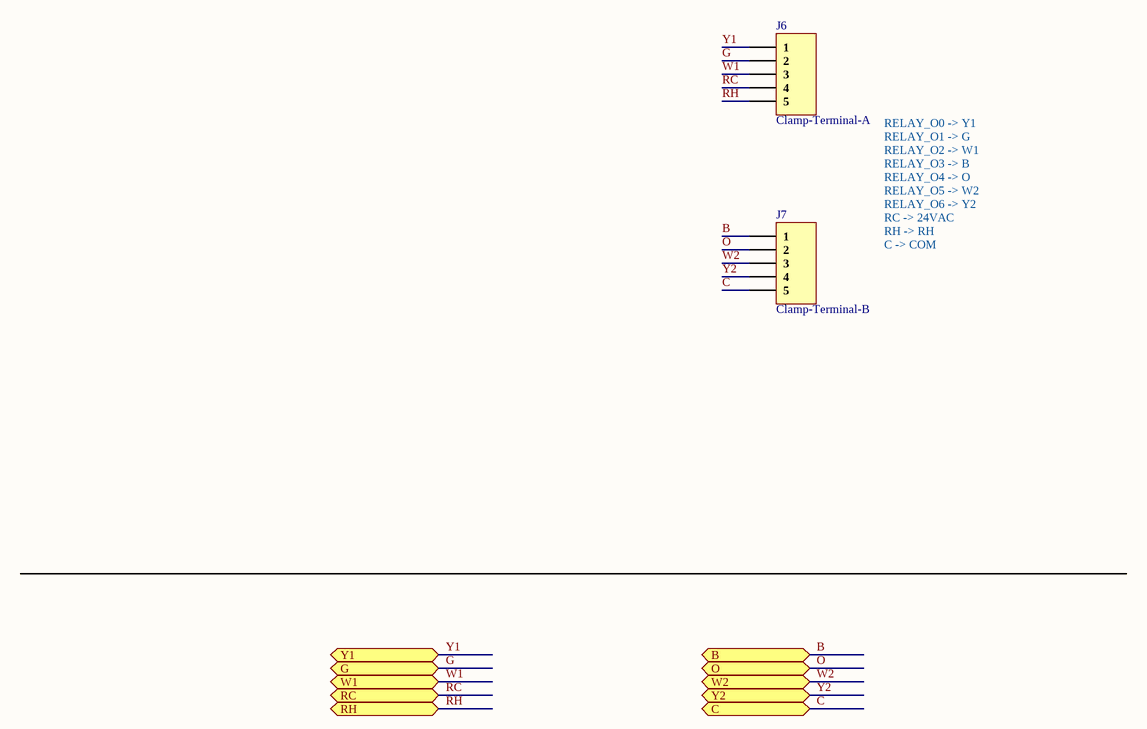
[diagram p5: Output-Connection-Sheet.SchDoc]

### Parts
J6  Clamp-Terminal-A  [Clamp-Terminal-A]
J7  Clamp-Terminal-B  [Clamp-Terminal-B.]

### Ports
B (bidir), C (bidir), G (bidir), O (bidir), RC (bidir), RH (bidir), W1 (bidir), W2 (bidir), Y1 (bidir), Y2 (bidir)

### Nets
B: J7.1 ; port B
C: J7.5 ; port C
G: J6.2 ; port G
O: J7.2 ; port O
RC: J6.4 ; port RC
RH: J6.5 ; port RH  [project net RELAY_IN]
W1: J6.3 ; port W1  [project net RELAY_O2]
W2: J7.3 ; port W2  [project net RELAY_O5]
Y1: J6.1 ; port Y1  [project net RELAY_O0]
Y2: J7.4 ; port Y2  [project net RELAY_O6]

### Notes on the sheet
- RELAY_O0 -> Y1
  RELAY_O1 -> G
  RELAY_O2 -> W1
  RELAY_O3 -> B
  RELAY_O4 -> O
  RELAY_O5 -> W2
  RELAY_O6 -> Y2
  RC -> 24VAC
  RH -> RH
  C -> COM
- File:
- Title:
- Date:
- Page
- Num:
- Total:
- Drawn By: Huzaifa Ali

### Library data of the parts
J6 = Clamp-Terminal-A: PinHeader_1x05_P5.00mm_Vertical
J7 = Clamp-Terminal-B: PinHeader_1x05_P5.00mm_Vertical

## Sheet Level-Shifter-Sheet.SchDoc: =Projectname
size A4; SheetNumber: 7; SheetTotal: 9
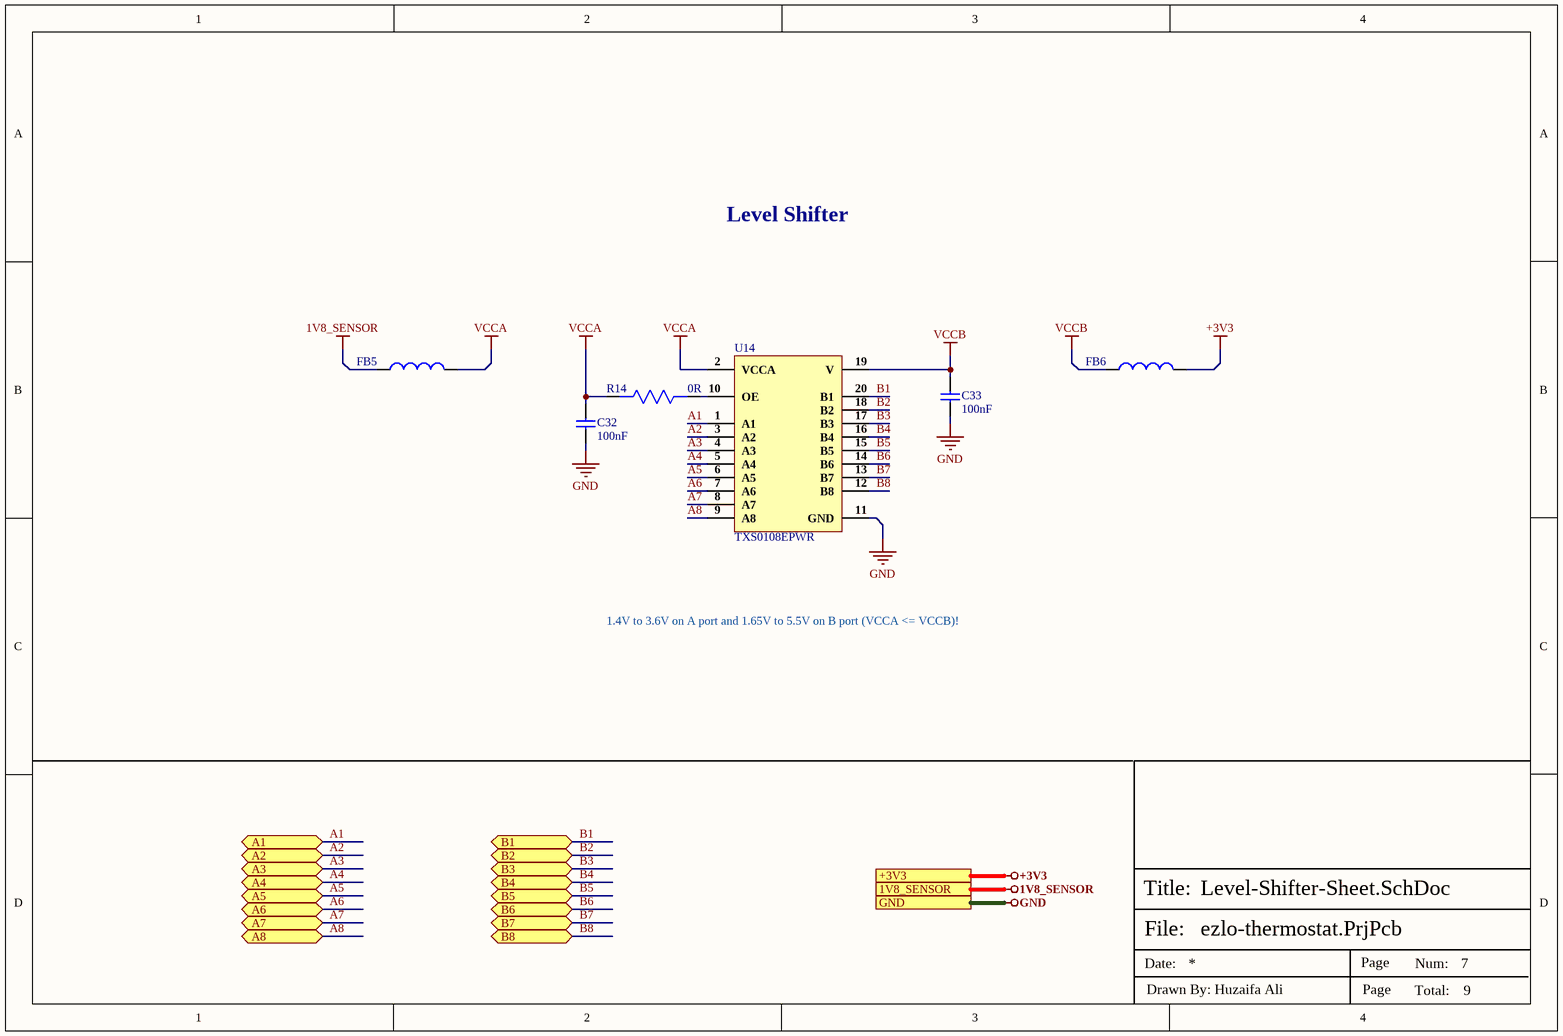
[diagram p6: Level-Shifter-Sheet.SchDoc]

### Parts
C32  100nF  [Cap-0402]
C33  100nF  [Cap-0402]
FB5  100MHz  [IND-0402]  (value not drawn)
FB6  100MHz  [IND-0402]  (value not drawn)
R14  0R  [Res-0402]
U14  TXS0108EPWR  [TSSOP-20]

### Ports
1V8_SENSOR, +3V3, A1 (bidir), A2 (bidir), A3 (bidir), A4 (bidir), A5 (bidir), A6 (bidir), A7 (bidir), A8 (bidir), B1 (bidir), B2 (bidir), B3 (bidir), B4 (bidir), B5 (bidir), B6 (bidir), B7 (bidir), B8 (bidir), GND

### Nets
1V8_SENSOR: FB5.1 ; port 1V8_SENSOR
+3V3: FB6.2 ; port +3V3
GND: C32.1 C33.2 U14.11(GND) ; port GND
VCCA: C32.2 FB5.2 R14.2 U14.2(VCCA)
VCCB: C33.1 FB6.1 U14.19(V)
A1: U14.1(A1) ; port A1
A2: U14.3(A2) ; port A2
A3: U14.4(A3) ; port A3
A4: U14.5(A4) ; port A4
A5: U14.6(A5) ; port A5
A6: U14.7(A6) ; port A6
A7: U14.8(A7) ; port A7
A8: U14.9(A8) ; port A8
B1: U14.20(B1) ; port B1
B2: U14.18(B2) ; port B2
B3: U14.17(B3) ; port B3
B4: U14.16(B4) ; port B4
B5: U14.15(B5) ; port B5
B6: U14.14(B6) ; port B6
B7: U14.13(B7) ; port B7
B8: U14.12(B8) ; port B8
NetR14_1: R14.1 U14.10(OE)

### Notes on the sheet
- Level Shifter
- 1.4V to 3.6V on A port and 1.65V to 5.5V on B port (VCCA <= VCCB)!
- File:
- Title:
- Date:
- Page
- Num:
- Total:
- Drawn By: Huzaifa Ali

### Library data of the parts
C32 C33 = CC0402KRX5R8BB104: as C23 on sheet Output-Sheet; Supplier 1: Digi-Key; Manufacturer Part Number: CC0402KRX5R8BB104; RoHS: Yes; Category: Ceramic Capacitors; Stock 1: 4598218; Pricing 1: 1=0.10000, 10=0.03800, 50=0.02100, 100=0.01710, 500=0.01224, 1000=0.00961, 2500=0.00874, 5000=0.00804 (USD); Mount: Surface Mount; Case/Package: 0402; Case Code (Metric): 1005; Case Code (Imperial): 0402; Min Operating Temperature: -55°C; Max Operating Temperature: 85°C; Voltage Rating: 25V; Packaging: Tape and Reel; Capacitance: 100nF; Voltage Rating (DC): 25V; Dielectric: X5R; Resistor Type: Ceramic; Series: CC; Length: 0.039inch; Width: 0.02inch; Thickness: 0.022inch; Depth: 0.5mm; Lead Free: Lead Free; Halogen Free: Halogen Free; RoHS Compliant: Yes; ComponentLink1URL: http://www.mouser.com/ds/2/447/UPY-GPHC_X5R_4V-to-50V_25-1131599.pdf?src-supplier=Mouser; ComponentLink1Description: http://www.mouser.com/ds/2/447/UPY-GPHC_X5R_4V-to-50V_25-1131599.pdf?src-supplier=Mouser; ComponentLink2URL: http://www.yageo.com/documents/recent/UPY-GPHC_X5R_4V-to-50V-16.pdf?src-supplier=Future+Electronics; ComponentLink2Description: http://www.yageo.com/documents/recent/UPY-GPHC_X5R_4V-to-50V-16.pdf?src-supplier=Future+Electronics; ComponentLink3URL: http://www.yageo.com/documents/recent/UPY-GPHC_X5R_4V-to-50V_25.pdf?src-supplier=Digi-Key; ComponentLink3Description: http://www.yageo.com/documents/recent/UPY-GPHC_X5R_4V-to-50V_25.pdf?src-supplier=Digi-Key; Supplier Part Number 1: 311-1697-1-ND; LCSC Part Number: C106256
FB5 FB6 = BLM15PD121SN1D: FERRITE BEAD 120 OHM 0402 1LN; Manufacturer: Murata; Material: Steel,Ferrite; Tolerance: 25%; Impedance: 120R; Current Rating: 1.3A; Number of Lines: 1; DC Resistance (DCR): 90mR; Supplier 1: Avnet; Manufacturer Part Number: BLM15PD121SN1D; RoHS: Yes; Category: Ferrite Beads and Chips; Stock 1: 300000; Pricing 1: 10000=0.03238, 20000=0.03063, 40000=0.02888, 60000=0.02713, 80000=0.02538, 100000=0.02363, 1000000=0.02188 (USD); Case/Package: 0402; Number of Pins: 2; Core Material: Ferrite; Case Code (Metric): 1005; Case Code (Imperial): 0402; Min Operating Temperature: -55°C; Max Operating Temperature: 125°C; Package Quantity: 1; Packaging: Tape and Reel; Max Current Rating: 1.3A; Termination: SMD/SMT; Max DC Current: 1.3A; Test Frequency: 100MHz; DC Current: 1.3A; Number of Circuits: 1; Series: BLM15PD; DC Resistance-Max: 90mR; Length: 1mm; Width: 0.5mm; Height: 0.5mm; Depth: 0.55mm; Radiation Hardening: No; Reach SVHC Compliant: Yes; Military Standard: Not; Lead Free: Lead Free; RoHS Compliant: Yes; ComponentLink1URL: https://datasheet.ciiva.com/11800/0900766b811b5866-11800860.pdf?src-supplier=RSComponents; ComponentLink1Description: https://datasheet.ciiva.com/11800/0900766b811b5866-11800860.pdf?src-supplier=RSComponents; ComponentLink2URL: https://datasheet.ciiva.com/18093/getdatasheetpartid-195858-18093157.pdf?src-supplier=Verical; ComponentLink2Description: https://datasheet.ciiva.com/18093/getdatasheetpartid-195858-18093157.pdf?src-supplier=Verical; ComponentLink3URL: https://datasheet.ciiva.com/41425/001171686-da-01-en-chip-drossel0402-120r-1300ma-1-0x0-5mm-41425776.pdf?src-supplier=Conrad; ComponentLink3Description: https://datasheet.ciiva.com/41425/001171686-da-01-en-chip-drossel0402-120r-1300ma-1-0x0-5mm-41425776.pdf?src-supplier=Conrad; ComponentLink4URL: https://datasheet.ciiva.com/41449/001172205-da-01-en-drossel-0402-120r-11-0x0-5mm-10000st-41449495.pdf?src-supplier=Conrad; ComponentLink4Description: https://datasheet.ciiva.com/41449/001172205-da-01-en-drossel-0402-120r-11-0x0-5mm-10000st-41449495.pdf?src-supplier=Conrad; ComponentLink5URL: https://datasheet.ciiva.com/1012/l0110e-1012435.pdf?src-supplier=Digi-Key; ComponentLink5Description: https://datasheet.ciiva.com/1012/l0110e-1012435.pdf?src-supplier=Digi-Key; ComponentLink6URL: https://datasheet.ciiva.com/1012/l0110e-1012434.pdf?src-supplier=Digi-Key; ComponentLink6Description: https://datasheet.ciiva.com/1012/l0110e-1012434.pdf?src-supplier=Digi-Key; ComponentLink7URL: https://datasheet.ciiva.com/1012/l0110e-1012436.pdf?src-supplier=Digi-Key; ComponentLink7Description: https://datasheet.ciiva.com/1012/l0110e-1012436.pdf?src-supplier=Digi-Key; Supplier Part Number 1: BLM15PD121SN1D; LCSC Part Number: C76891; Item Type: Ferrite Bead
R14 = RC0402FR-070RL: RES 0 OHM JUMPER 1/16W 0402; Manufacturer: Yageo; Tolerance: 1%; Power Rating: 62.5mW; Voltage Rating: 50V; Temperature Coefficient: 200ppm/°C; Max Power Dissipation: 63mW; Supplier 1: Mouser; Manufacturer Part Number: RC0402FR-070RL; RoHS: Yes; Category: Chip SMD Resistors; Stock 1: 8556842; Pricing 1: 1=0.10000, 10=0.01400, 50=0.01400, 100=0.00600, 1000=0.00300, 5000=0.00200, 10000=0.00100 (USD); Mount: Surface Mount; Case/Package: 0402; Contact Plating: Tin,Matte; Case Code (Imperial): 0402; Case Code (Metric): 1005; Size Code: 0402; Min Operating Temperature: -55°C; Max Operating Temperature: 155°C; Resistance: 0R; Resistor Type: Thick Film; Packaging: Tape and Reel; Termination: SMD/SMT; Features: Moisture Resistant; Series: RC; Number of Terminations: 2; Length: 1mm; Width: 0.5mm; Height: 0.35mm; Radiation Hardening: No; Lead Free: Lead Free; RoHS Compliant: Yes; ComponentLink1URL: https://datasheet.ciiva.com/8896/pyu-rc0402-51-rohs-l-6-8896149.pdf?src-supplier=Avnet; ComponentLink1Description: https://datasheet.ciiva.com/8896/pyu-rc0402-51-rohs-l-6-8896149.pdf?src-supplier=Avnet; ComponentLink2URL: https://datasheet.ciiva.com/16790/pyu-rc0402-51-rohs-l-6-r-16790444.pdf?src-supplier=Future+Electronics; ComponentLink2Description: https://datasheet.ciiva.com/16790/pyu-rc0402-51-rohs-l-6-r-16790444.pdf?src-supplier=Future+Electronics; Supplier Part Number 1: 603-RC0402FR-070RL; LCSC Part Number: C106231
U14 = TXS0108EPWR: IC TRANSLATOR BIDIR 20TSSOP; Manufacturer: Texas Instruments; Manufacturer Part Number: TXS0108EPWR; Package: 20-TSSOP; LCSC Part Number: C17206; Item Type: IC; ComponentLink1Description: LCSC; ComponentLink1URL: https://www.lcsc.com/product-detail/Translators-Level-Shifters_Texas-Instruments-TXS0108EPWR_C17206.html